# Altium schematic sheet H-bridge.SchDoc: =DT_SCH_Title
size A4; Organization: Droid Technologies; SheetNumber: 9; SheetTotal: 14
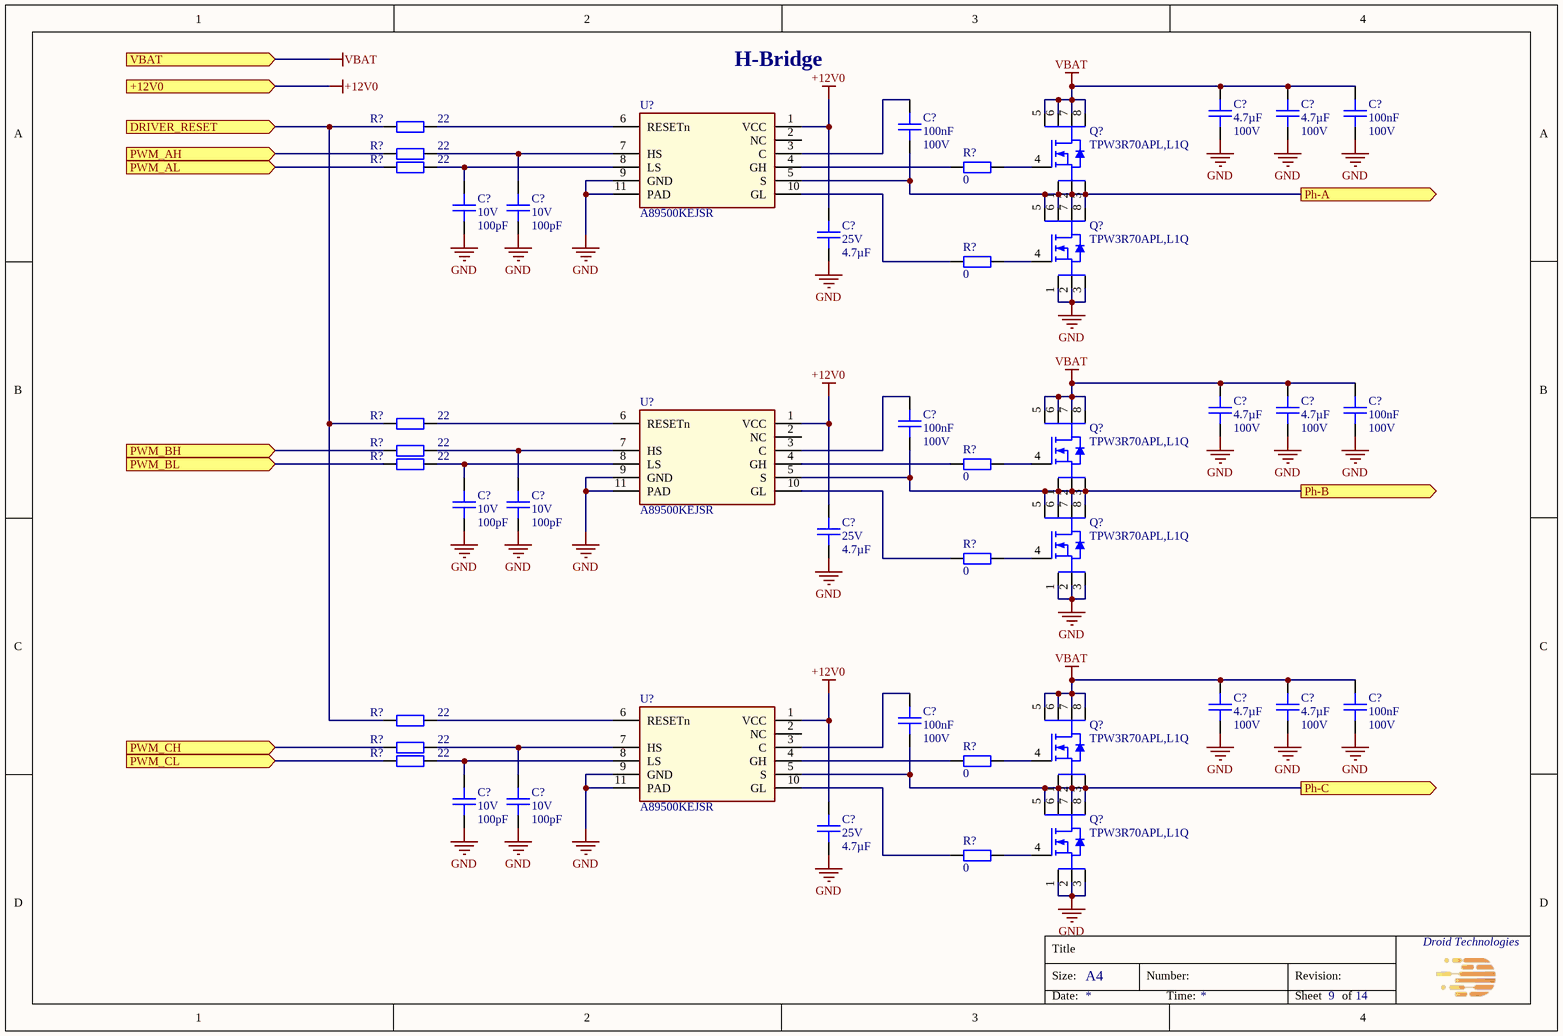
[diagram p0: H-bridge.SchDoc]

## Parts
(Parts that share a designator on the sheet are numbered #1, #2 ... from top to bottom, then left to right.)
C?#1  Capacitance: 4.7µF  Voltage Rating: 100V  [CAPC320X250X250L60]  (hidden comment: CL32E475KCIVPJE)
C?#2  Capacitance: 4.7µF  Voltage Rating: 100V  [CAPC320X250X250L60]  (hidden comment: CL32E475KCIVPJE)
C?#3  Capacitance: 100nF  Voltage Rating: 100V  [CAPC160X80X90L35]  (hidden comment: GCJ188L8EL104KA07D)
C?#4  Capacitance: 100nF  Voltage Rating: 100V  [CAPC160X80X90L35]  (hidden comment: GCJ188L8EL104KA07D)
C?#5  Voltage Rating: 10V  Capacitance: 100pF  [CAPC160X80X90L35]  (hidden comment: C0603C101K8HACAUTO)
C?#6  Voltage Rating: 10V  Capacitance: 100pF  [CAPC160X80X90L35]  (hidden comment: C0603C101K8HACAUTO)
C?#7  Voltage Rating: 25V  Capacitance: 4.7µF  [CAPC200X125X145L50]  (hidden comment: CGA4J1X8L1E475K125AC)
C?#8  Capacitance: 4.7µF  Voltage Rating: 100V  [CAPC320X250X250L60]  (hidden comment: CL32E475KCIVPJE)
C?#9  Capacitance: 4.7µF  Voltage Rating: 100V  [CAPC320X250X250L60]  (hidden comment: CL32E475KCIVPJE)
C?#10  Capacitance: 100nF  Voltage Rating: 100V  [CAPC160X80X90L35]  (hidden comment: GCJ188L8EL104KA07D)
C?#11  Capacitance: 100nF  Voltage Rating: 100V  [CAPC160X80X90L35]  (hidden comment: GCJ188L8EL104KA07D)
C?#12  Voltage Rating: 10V  Capacitance: 100pF  [CAPC160X80X90L35]  (hidden comment: C0603C101K8HACAUTO)
C?#13  Voltage Rating: 10V  Capacitance: 100pF  [CAPC160X80X90L35]  (hidden comment: C0603C101K8HACAUTO)
C?#14  Voltage Rating: 25V  Capacitance: 4.7µF  [CAPC200X125X145L50]  (hidden comment: CGA4J1X8L1E475K125AC)
C?#15  Capacitance: 4.7µF  Voltage Rating: 100V  [CAPC320X250X250L60]  (hidden comment: CL32E475KCIVPJE)
C?#16  Capacitance: 4.7µF  Voltage Rating: 100V  [CAPC320X250X250L60]  (hidden comment: CL32E475KCIVPJE)
C?#17  Capacitance: 100nF  Voltage Rating: 100V  [CAPC160X80X90L35]  (hidden comment: GCJ188L8EL104KA07D)
C?#18  Capacitance: 100nF  Voltage Rating: 100V  [CAPC160X80X90L35]  (hidden comment: GCJ188L8EL104KA07D)
C?#19  Voltage Rating: 10V  Capacitance: 100pF  [CAPC160X80X90L35]  (hidden comment: C0603C101K8HACAUTO)
C?#20  Voltage Rating: 10V  Capacitance: 100pF  [CAPC160X80X90L35]  (hidden comment: C0603C101K8HACAUTO)
C?#21  Voltage Rating: 25V  Capacitance: 4.7µF  [CAPC200X125X145L50]  (hidden comment: CGA4J1X8L1E475K125AC)
Q?#1  TPW3R70APL,L1Q  [TOSHIBA_2-5Q1A]
Q?#2  TPW3R70APL,L1Q  [TOSHIBA_2-5Q1A]
Q?#3  TPW3R70APL,L1Q  [TOSHIBA_2-5Q1A]
Q?#4  TPW3R70APL,L1Q  [TOSHIBA_2-5Q1A]
Q?#5  TPW3R70APL,L1Q  [TOSHIBA_2-5Q1A]
Q?#6  TPW3R70APL,L1Q  [TOSHIBA_2-5Q1A]
R?#1  Resistance: 22  [RESC100X50X40L25]  (hidden comment: RC0402FR-0722RL)
R?#2  Resistance: 22  [RESC100X50X40L25]  (hidden comment: RC0402FR-0722RL)
R?#3  Resistance: 22  [RESC100X50X40L25]  (hidden comment: RC0402FR-0722RL)
R?#4  Resistance: 0  [RESC160X80X55L30]  (hidden comment: RC0603FR-070RL)
R?#5  Resistance: 0  [RESC160X80X55L30]  (hidden comment: RC0603FR-070RL)
R?#6  Resistance: 22  [RESC100X50X40L25]  (hidden comment: RC0402FR-0722RL)
R?#7  Resistance: 22  [RESC100X50X40L25]  (hidden comment: RC0402FR-0722RL)
R?#8  Resistance: 22  [RESC100X50X40L25]  (hidden comment: RC0402FR-0722RL)
R?#9  Resistance: 0  [RESC160X80X55L30]  (hidden comment: RC0603FR-070RL)
R?#10  Resistance: 0  [RESC160X80X55L30]  (hidden comment: RC0603FR-070RL)
R?#11  Resistance: 22  [RESC100X50X40L25]  (hidden comment: RC0402FR-0722RL)
R?#12  Resistance: 22  [RESC100X50X40L25]  (hidden comment: RC0402FR-0722RL)
R?#13  Resistance: 22  [RESC100X50X40L25]  (hidden comment: RC0402FR-0722RL)
R?#14  Resistance: 0  [RESC160X80X55L30]  (hidden comment: RC0603FR-070RL)
R?#15  Resistance: 0  [RESC160X80X55L30]  (hidden comment: RC0603FR-070RL)
U?#1  A89500KEJSR  [A89500KEJSR]
U?#2  A89500KEJSR  [A89500KEJSR]
U?#3  A89500KEJSR  [A89500KEJSR]

## Ports
+12V0 (in), DRIVER_RESET (in), Ph-A (out), Ph-B (out), Ph-C (out), PWM_AH (in), PWM_AL (in), PWM_BH (in), PWM_BL (in), PWM_CH (in), PWM_CL (in), VBAT (in)

## Nets
+12V0: C?#7.2 C?#14.2 C?#21.2 U?#1.1(VCC) U?#2.1(VCC) U?#3.1(VCC) ; port +12V0
GND: C?#1.1 C?#2.1 C?#3.1 C?#5.1 C?#6.1 C?#7.1 C?#8.1 C?#9.1 C?#10.1 C?#12.1 C?#13.1 C?#14.1 C?#15.1 C?#16.1 C?#17.1 C?#19.1 C?#20.1 C?#21.1 Q?#2.1 Q?#2.2 Q?#2.3 Q?#4.1 Q?#4.2 Q?#4.3 Q?#6.1 Q?#6.2 Q?#6.3 U?#1.9(GND) U?#1.11(PAD) U?#2.9(GND) U?#2.11(PAD) U?#3.9(GND) U?#3.11(PAD)
VBAT: C?#1.2 C?#2.2 C?#3.2 C?#8.2 C?#9.2 C?#10.2 C?#15.2 C?#16.2 C?#17.2 Q?#1.5 Q?#1.6 Q?#1.7 Q?#1.8 Q?#3.5 Q?#3.6 Q?#3.7 Q?#3.8 Q?#5.5 Q?#5.6 Q?#5.7 Q?#5.8 ; port VBAT
DRIVER_RESET: R?#1.1 R?#6.1 R?#11.1 ; port DRIVER_RESET
Ph-A: C?#4.1 Q?#1.1 Q?#1.2 Q?#1.3 Q?#2.5 Q?#2.6 Q?#2.7 Q?#2.8 U?#1.5(S) ; port Ph-A
Ph-B: C?#11.1 Q?#3.1 Q?#3.2 Q?#3.3 Q?#4.5 Q?#4.6 Q?#4.7 Q?#4.8 U?#2.5(S) ; port Ph-B
Ph-C: C?#18.1 Q?#5.1 Q?#5.2 Q?#5.3 Q?#6.5 Q?#6.6 Q?#6.7 Q?#6.8 U?#3.5(S) ; port Ph-C
PWM_AH: R?#2.1 ; port PWM_AH
PWM_AL: R?#3.1 ; port PWM_AL
PWM_BH: R?#7.1 ; port PWM_BH
PWM_BL: R?#8.1 ; port PWM_BL
PWM_CH: R?#12.1 ; port PWM_CH
PWM_CL: R?#13.1 ; port PWM_CL
NetC?#4_2: C?#4.2 U?#1.3(C)
NetC?#5_2: C?#5.2 R?#3.2 U?#1.8(LS)
NetC?#6_2: C?#6.2 R?#2.2 U?#1.7(HS)
NetC?#11_2: C?#11.2 U?#2.3(C)
NetC?#12_2: C?#12.2 R?#8.2 U?#2.8(LS)
NetC?#13_2: C?#13.2 R?#7.2 U?#2.7(HS)
NetC?#18_2: C?#18.2 U?#3.3(C)
NetC?#19_2: C?#19.2 R?#13.2 U?#3.8(LS)
NetC?#20_2: C?#20.2 R?#12.2 U?#3.7(HS)
NetQ?#1_4: Q?#1.4 R?#4.2
NetQ?#2_4: Q?#2.4 R?#5.2
NetQ?#3_4: Q?#3.4 R?#9.2
NetQ?#4_4: Q?#4.4 R?#10.2
NetQ?#5_4: Q?#5.4 R?#14.2
NetQ?#6_4: Q?#6.4 R?#15.2
NetR?#1_2: R?#1.2 U?#1.6(RESETn)
NetR?#4_1: R?#4.1 U?#1.4(GH)
NetR?#5_1: R?#5.1 U?#1.10(GL)
NetR?#6_2: R?#6.2 U?#2.6(RESETn)
NetR?#9_1: R?#9.1 U?#2.4(GH)
NetR?#10_1: R?#10.1 U?#2.10(GL)
NetR?#11_2: R?#11.2 U?#3.6(RESETn)
NetR?#14_1: R?#14.1 U?#3.4(GH)
NetR?#15_1: R?#15.1 U?#3.10(GL)

Not connected (* = marked no-connect by the designer): U?#1 2(NC); U?#2 2(NC); U?#3 2(NC)

## Notes on the sheet
- H-Bridge
- Title
- Size:
- A4
- Number:
- Revision:
- Date:
- Time:
- Sheet
- of

## Library data of the parts
C?#1 C?#2 C?#8 C?#9 C?#15 C?#16 = CMP-001-2005-1: CAP CER 4.7UF 100V X8L 1210; Manufacturer: Samsung Electro-Mechanics; Op Temp min: -55°C; Tolerance: 10%; Op Temp max: 150°C; Lead Spacing: 0mm; ComponentLink3Description: Digikey; ComponentLink1Description: Datasheet; ComponentLink3URL: https://www.digikey.com/en/products/detail/samsung-electro-mechanics/CL32E475KCIVPJE/20498500; Ratings: AEC-Q200; ComponentLink2URL: https://eu.mouser.com/ProductDetail/Samsung-Electro-Mechanics/CL32E475KCIVPJE?qs=Imq1NPwxi77B1%252BqSJu7fiA%3D%3D; ComponentLink1URL: https://mm.digikey.com/Volume0/opasdata/d220001/medias/docus/5458/CL32E475KCIVPJE_Spec.pdf; MPN: CL32E475KCIVPJE; Mounting Type: SM; Size: 3.20mm x 2.50mm; Dielectric: X8L; ComponentLink2Description: Mouser; Package: 1210 (3225 Metric); Height max: 2.3mm
C?#3 C?#4 C?#10 C?#11 C?#17 C?#18 = CMP-001-2003-1: CAP CER 0.1UF 100V X8L 0603; Manufacturer: Murata Electronics; Tolerance: 10%; Op Temp min: -55°C; Op Temp max: 150°C; Package: 0603 (1608 Metric); ComponentLink3URL: https://www.digikey.com/en/products/detail/murata-electronics/GCJ188L8EL104KA07D/11618648; Lead Spacing: 0mm; ComponentLink1Description: Datasheet; ComponentLink1URL: https://www.murata.com/en-sg/api/pdfdownloadapi?cate=luCeramicCapacitorsSMD&partno=GCJ188L8EL104KA07%23; ComponentLink3Description: Digikey; MPN: GCJ188L8EL104KA07D; Ratings: AEC-Q200; ComponentLink2Description: Mouser; Height max: 900µm; Dielectric: X8L; Mounting Type: SM; ComponentLink2URL: https://eu.mouser.com/ProductDetail/Murata-Electronics/GCJ188L8EL104KA07D?qs=rrS6PyfT74fTpbPMbkPm2A%3D%3D; Size: 1.60mm x 0.80mm
C?#5 C?#6 C?#12 C?#13 C?#19 C?#20 = CMP-001-2002-1: CAP CER 0603 100PF 10V ULTRA STA; Manufacturer: KEMET; Dielectric: X8R; Op Temp max: 150°C; Op Temp min: -55°C; Tolerance: 10%; ComponentLink2Description: Mouser; Height max: 870µm; ComponentLink3Description: Digikey; ComponentLink3URL: https://www.digikey.com/en/products/detail/kemet/C0603C101K8HACAUTO/7957168; ComponentLink2URL: https://eu.mouser.com/ProductDetail/KEMET/C0603C101K8HACAUTO?qs=j%252B1pi9TdxUaad%2FlKIn1CPA%3D%3D; Lead Spacing: 0mm; Package: 0603 (1608 Metric); MPN: C0603C101K8HACAUTO; Mounting Type: SM; ComponentLink1URL: https://content.kemet.com/datasheets/KEM_C1007_X8R_ULTRA_150C_SMD.pdf; Ratings: AEC-Q200; Size: 1.60mm x 0.80mm; ComponentLink1Description: Datasheet
C?#7 C?#14 C?#21 = CMP-001-2004-1: CAP CER 4.7UF 25V X8L 0805; Manufacturer: TDK Corporation; Op Temp max: 150°C; Op Temp min: -55°C; Tolerance: 10%; ComponentLink1URL: https://product.tdk.com/system/files/dam/doc/product/capacitor/ceramic/mlcc/catalog/mlcc_automotive_hightemp_en.pdf; Package: 0805 (2012 Metric); Size: (2.00mm x 1.25mm; Height max: 1.5mm; Lead Spacing: 0mm; Ratings: AEC-Q200; ComponentLink1Description: Datasheet; ComponentLink3Description: Digikey; MPN: CGA4J1X8L1E475K125AC; Mounting Type: SM; ComponentLink2URL: https://eu.mouser.com/ProductDetail/TDK/CGA4J1X8L1E475K125AC?qs=gZXFycFWdANxpKJOMQuJTA%3D%3D; ComponentLink3URL: https://www.digikey.com/en/products/detail/tdk-corporation/CGA4J1X8L1E475K125AC/9991390; ComponentLink2Description: Mouser; Dielectric: X8L
Q?#1-Q?#6 = TPW3R70APL,L1Q: PB-F POWER MOSFET TRANSISTOR DSO; Manufacturer: Toshiba Semiconductor and Storage; MPN: TPW3R70APL,L1Q
R?#1-R?#3 R?#6-R?#8 R?#11-R?#13 = CMP-001-0482-4: RES 22 OHM 1% 1/16W 0402; Manufacturer: YAGEO; Temperature Coefficient: ±100ppm; Op Temp max: 155°C; Op Temp min: -55°C; Power: 63mW; Ratings: -; ComponentLink3URL: https://www.digikey.com/en/products/detail/yageo/RC0402FR-0722RL/726562; ComponentLink2URL: https://eu.mouser.com/ProductDetail/YAGEO/RC0402FR-0722RL?qs=V1yeUXFNrkkRg6zf08ADKQ%3D%3D; MPN: RC0402FR-0722RL; ComponentLink1Description: Datasheet; ComponentLink3Description: Digikey; Tolerance: 1%; Size: 1.00mm x 0.50mm; ComponentLink1URL: https://www.yageo.com/upload/media/product/productsearch/datasheet/rchip/PYu-RC_Group_51_RoHS_L_12.pdf; Composition: Thick Film; ComponentLink2Description: Mouser; Mounting Type: SM; Package: 0402 (1005 Metric); Height max: 400µm
R?#4 R?#5 R?#9 R?#10 R?#14 R?#15 = CMP-001-0927-2: RES 0 OHM JUMPER 1/10W 0603; Manufacturer: YAGEO; Op Temp min: -55°C; Op Temp max: 155°C; Power: 100mW; Tolerance: 0%; Height max: 550µm; ComponentLink2URL: https://eu.mouser.com/ProductDetail/YAGEO/RC0603FR-070RL?qs=0yPvnVz5%2FmpDQv43TwvCfw%3D%3D; Temperature Coefficient: -; ComponentLink3Description: Digikey; ComponentLink2Description: Mouser; MPN: RC0603FR-070RL; ComponentLink1URL: https://www.yageo.com/upload/media/product/productsearch/datasheet/rchip/PYu-RC_Group_51_RoHS_L_12.pdf; Ratings: -; Size: 1.60mm x 0.80mm; Composition: Thick Film; Mounting Type: SM; ComponentLink3URL: https://www.digikey.com/en/products/detail/yageo/RC0603FR-070RL/1304008; Package: 0603 (1608 Metric); ComponentLink1Description: Datasheet
U?#1-U?#3 = A89500KEJSR: IC GATE DRVR HALF-BRIDGE 10DFN; Manufacturer: Allegro MicroSystems; MPN: A89500KEJSR